# Altium schematic sheet Debug.SchDoc
size A4; SheetNumber: 7; SheetTotal: 7
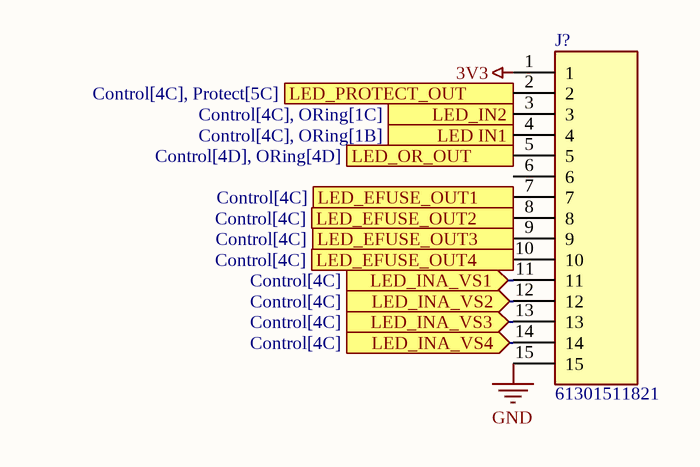
[diagram p0: Debug.SchDoc]

## Parts
J?  61301511821  [61301511821]

## Ports
LED IN1 (in, see Control[4C], ORing[1B]), LED_EFUSE_OUT1 (in, see Control[4C]), LED_EFUSE_OUT2 (in, see Control[4C]), LED_EFUSE_OUT3 (in, see Control[4C]), LED_EFUSE_OUT4 (in, see Control[4C]), LED_IN2 (in, see Control[4C], ORing[1C]), LED_INA_VS1 (in, see Control[4C]), LED_INA_VS2 (in, see Control[4C]), LED_INA_VS3 (in, see Control[4C]), LED_INA_VS4 (in, see Control[4C]), LED_OR_OUT (in, see Control[4D], ORing[4D]), LED_PROTECT_OUT (in, see Control[4C], Protect[5C])

## Nets
3V3: J?.1
GND: J?.15
LED IN1: J?.4 ; port LED IN1
LED_EFUSE_OUT1: J?.7 ; port LED_EFUSE_OUT1
LED_EFUSE_OUT2: J?.8 ; port LED_EFUSE_OUT2
LED_EFUSE_OUT3: J?.9 ; port LED_EFUSE_OUT3
LED_EFUSE_OUT4: J?.10 ; port LED_EFUSE_OUT4
LED_IN2: J?.3 ; port LED_IN2
LED_INA_VS1: J?.11 ; port LED_INA_VS1
LED_INA_VS2: J?.12 ; port LED_INA_VS2
LED_INA_VS3: J?.13 ; port LED_INA_VS3
LED_INA_VS4: J?.14 ; port LED_INA_VS4
LED_OR_OUT: J?.5 ; port LED_OR_OUT
LED_PROTECT_OUT: J?.2 ; port LED_PROTECT_OUT

Not connected (* = marked no-connect by the designer): J? 6

## Library data of the parts
J? = 61301511821: Connector; Manufacturer_Name: Wurth Elektronik; Datasheet Link: https://www.we-online.com/catalog/datasheet/61301511821.pdf; Height: 8.65mm; Manufacturer_Part_Number: 61301511821